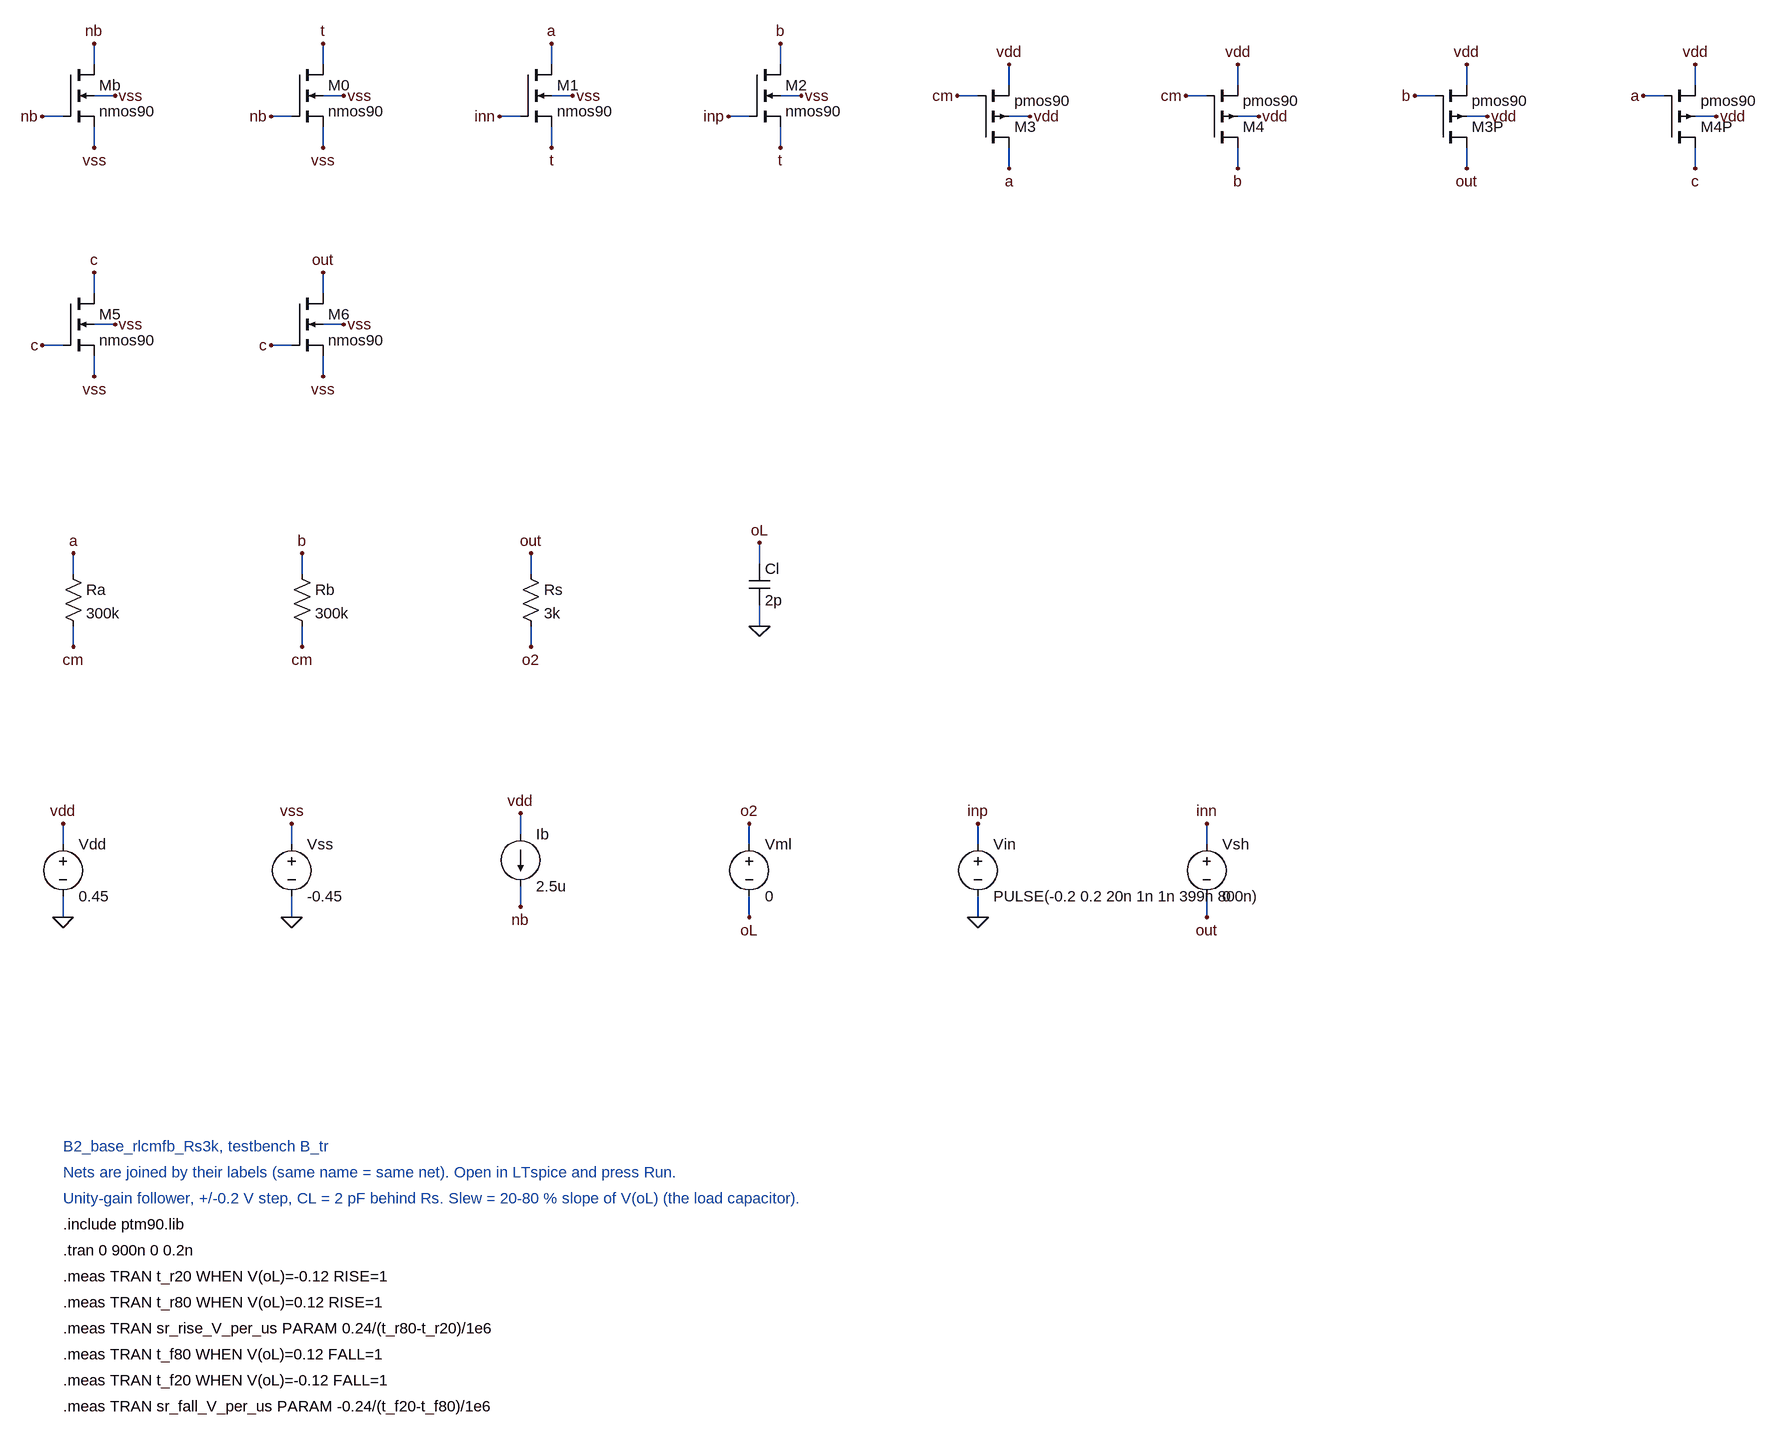
[diagram p0: schematic B2_base_rlcmfb_Rs3k_B_tr.asc]
B2_base_rlcmfb_Rs3k_B_tr.asc, the LTspice schematic file:
Version 4
SHEET 1 3200 2400
WIRE 48 0 48 -32
WIRE 0 80 -32 80
WIRE 48 96 48 128
WIRE 48 48 80 48
WIRE 400 0 400 -32
WIRE 352 80 320 80
WIRE 400 96 400 128
WIRE 400 48 432 48
WIRE 752 0 752 -32
WIRE 704 80 672 80
WIRE 752 96 752 128
WIRE 752 48 784 48
WIRE 1104 0 1104 -32
WIRE 1056 80 1024 80
WIRE 1104 96 1104 128
WIRE 1104 48 1136 48
WIRE 1456 128 1456 160
WIRE 1408 48 1376 48
WIRE 1456 32 1456 0
WIRE 1456 80 1488 80
WIRE 1808 128 1808 160
WIRE 1760 48 1728 48
WIRE 1808 32 1808 0
WIRE 1808 80 1840 80
WIRE 2160 128 2160 160
WIRE 2112 48 2080 48
WIRE 2160 32 2160 0
WIRE 2160 80 2192 80
WIRE 2512 128 2512 160
WIRE 2464 48 2432 48
WIRE 2512 32 2512 0
WIRE 2512 80 2544 80
WIRE 48 352 48 320
WIRE 0 432 -32 432
WIRE 48 448 48 480
WIRE 48 400 80 400
WIRE 400 352 400 320
WIRE 352 432 320 432
WIRE 400 448 400 480
WIRE 400 400 432 400
WIRE 16 784 16 752
WIRE 16 864 16 896
WIRE 368 784 368 752
WIRE 368 864 368 896
WIRE 720 784 720 752
WIRE 720 864 720 896
WIRE 1072 768 1072 736
WIRE 1072 832 1072 864
WIRE 0 1200 0 1168
WIRE 0 1280 0 1312
WIRE 352 1200 352 1168
WIRE 352 1280 352 1312
WIRE 704 1184 704 1152
WIRE 704 1264 704 1296
WIRE 1056 1200 1056 1168
WIRE 1056 1280 1056 1312
WIRE 1408 1200 1408 1168
WIRE 1408 1280 1408 1312
WIRE 1760 1200 1760 1168
WIRE 1760 1280 1760 1312
FLAG 48 -32 nb
FLAG -32 80 nb
FLAG 48 128 vss
FLAG 80 48 vss
FLAG 400 -32 t
FLAG 320 80 nb
FLAG 400 128 vss
FLAG 432 48 vss
FLAG 752 -32 a
FLAG 672 80 inn
FLAG 752 128 t
FLAG 784 48 vss
FLAG 1104 -32 b
FLAG 1024 80 inp
FLAG 1104 128 t
FLAG 1136 48 vss
FLAG 1456 160 a
FLAG 1376 48 cm
FLAG 1456 0 vdd
FLAG 1488 80 vdd
FLAG 1808 160 b
FLAG 1728 48 cm
FLAG 1808 0 vdd
FLAG 1840 80 vdd
FLAG 2160 160 out
FLAG 2080 48 b
FLAG 2160 0 vdd
FLAG 2192 80 vdd
FLAG 2512 160 c
FLAG 2432 48 a
FLAG 2512 0 vdd
FLAG 2544 80 vdd
FLAG 48 320 c
FLAG -32 432 c
FLAG 48 480 vss
FLAG 80 400 vss
FLAG 400 320 out
FLAG 320 432 c
FLAG 400 480 vss
FLAG 432 400 vss
FLAG 16 752 a
FLAG 16 896 cm
FLAG 368 752 b
FLAG 368 896 cm
FLAG 720 752 out
FLAG 720 896 o2
FLAG 1072 736 oL
FLAG 1072 864 0
FLAG 0 1168 vdd
FLAG 0 1312 0
FLAG 352 1168 vss
FLAG 352 1312 0
FLAG 704 1152 vdd
FLAG 704 1296 nb
FLAG 1056 1168 o2
FLAG 1056 1312 oL
FLAG 1408 1168 inp
FLAG 1408 1312 0
FLAG 1760 1168 inn
FLAG 1760 1312 out
SYMBOL nmos4 0 0 R0
SYMATTR InstName Mb
SYMATTR Value nmos90
SYMATTR Value2 W=10u L=180n
SYMBOL nmos4 352 0 R0
SYMATTR InstName M0
SYMATTR Value nmos90
SYMATTR Value2 W=20u L=180n
SYMBOL nmos4 704 0 R0
SYMATTR InstName M1
SYMATTR Value nmos90
SYMATTR Value2 W=10u L=180n
SYMBOL nmos4 1056 0 R0
SYMATTR InstName M2
SYMATTR Value nmos90
SYMATTR Value2 W=10u L=180n
SYMBOL pmos4 1408 128 M180
SYMATTR InstName M3
SYMATTR Value pmos90
SYMATTR Value2 W=10u L=180n
SYMBOL pmos4 1760 128 M180
SYMATTR InstName M4
SYMATTR Value pmos90
SYMATTR Value2 W=10u L=180n
SYMBOL pmos4 2112 128 M180
SYMATTR InstName M3P
SYMATTR Value pmos90
SYMATTR Value2 W=10u L=180n
SYMBOL pmos4 2464 128 M180
SYMATTR InstName M4P
SYMATTR Value pmos90
SYMATTR Value2 W=10u L=180n
SYMBOL nmos4 0 352 R0
SYMATTR InstName M5
SYMATTR Value nmos90
SYMATTR Value2 W=10u L=180n
SYMBOL nmos4 352 352 R0
SYMATTR InstName M6
SYMATTR Value nmos90
SYMATTR Value2 W=10u L=180n
SYMBOL res 0 768 R0
SYMATTR InstName Ra
SYMATTR Value 300k
SYMBOL res 352 768 R0
SYMATTR InstName Rb
SYMATTR Value 300k
SYMBOL res 704 768 R0
SYMATTR InstName Rs
SYMATTR Value 3k
SYMBOL cap 1056 768 R0
SYMATTR InstName Cl
SYMATTR Value 2p
SYMBOL voltage 0 1184 R0
SYMATTR InstName Vdd
SYMATTR Value 0.45
SYMBOL voltage 352 1184 R0
SYMATTR InstName Vss
SYMATTR Value -0.45
SYMBOL current 704 1184 R0
SYMATTR InstName Ib
SYMATTR Value 2.5u
SYMBOL voltage 1056 1184 R0
SYMATTR InstName Vml
SYMATTR Value 0
SYMBOL voltage 1408 1184 R0
SYMATTR InstName Vin
SYMATTR Value PULSE(-0.2 0.2 20n 1n 1n 399n 800n)
SYMBOL voltage 1760 1184 R0
SYMATTR InstName Vsh
SYMATTR Value 0
TEXT 0 1664 Left 2 ;B2_base_rlcmfb_Rs3k, testbench B_tr
TEXT 0 1704 Left 2 ;Nets are joined by their labels (same name = same net). Open in LTspice and press Run.
TEXT 0 1744 Left 2 ;Unity-gain follower, +/-0.2 V step, CL = 2 pF behind Rs. Slew = 20-80 % slope of V(oL) (the load capacitor).
TEXT 0 1784 Left 2 !.include ptm90.lib
TEXT 0 1824 Left 2 !.tran 0 900n 0 0.2n
TEXT 0 1864 Left 2 !.meas TRAN t_r20 WHEN V(oL)=-0.12 RISE=1
TEXT 0 1904 Left 2 !.meas TRAN t_r80 WHEN V(oL)=0.12 RISE=1
TEXT 0 1944 Left 2 !.meas TRAN sr_rise_V_per_us PARAM 0.24/(t_r80-t_r20)/1e6
TEXT 0 1984 Left 2 !.meas TRAN t_f80 WHEN V(oL)=0.12 FALL=1
TEXT 0 2024 Left 2 !.meas TRAN t_f20 WHEN V(oL)=-0.12 FALL=1
TEXT 0 2064 Left 2 !.meas TRAN sr_fall_V_per_us PARAM -0.24/(t_f20-t_f80)/1e6

The netlist it stands for:
* B2_base_rlcmfb_Rs3k_B_tr.asc
Mb nb nb vss vss nmos90 W=10u L=180n
M0 t nb vss vss nmos90 W=20u L=180n
M1 a inn t vss nmos90 W=10u L=180n
M2 b inp t vss nmos90 W=10u L=180n
M3 a cm vdd vdd pmos90 W=10u L=180n
M4 b cm vdd vdd pmos90 W=10u L=180n
M3P out b vdd vdd pmos90 W=10u L=180n
M4P c a vdd vdd pmos90 W=10u L=180n
M5 c c vss vss nmos90 W=10u L=180n
M6 out c vss vss nmos90 W=10u L=180n
Ra a cm 300k
Rb b cm 300k
Rs out o2 3k
Cl oL 0 2p
Vdd vdd 0 0.45
Vss vss 0 -0.45
Ib vdd nb 2.5u
Vml o2 oL 0
Vin inp 0 PULSE(-0.2 0.2 20n 1n 1n 399n 800n)
Vsh inn out 0
.model NMOS NMOS
.model PMOS PMOS
.lib standard.mos
* B2_base_rlcmfb_Rs3k, testbench B_tr
* Nets are joined by their labels (same name = same net). Open in LTspice and press Run.
* Unity-gain follower, +/-0.2 V step, CL = 2 pF behind Rs. Slew = 20-80 % slope of V(oL) (the load capacitor).
.include ptm90.lib
.tran 0 900n 0 0.2n
.meas TRAN t_r20 WHEN V(oL)=-0.12 RISE=1
.meas TRAN t_r80 WHEN V(oL)=0.12 RISE=1
.meas TRAN sr_rise_V_per_us PARAM 0.24/(t_r80-t_r20)/1e6
.meas TRAN t_f80 WHEN V(oL)=0.12 FALL=1
.meas TRAN t_f20 WHEN V(oL)=-0.12 FALL=1
.meas TRAN sr_fall_V_per_us PARAM -0.24/(t_f20-t_f80)/1e6
.backanno
.end